# Altium project Control_Board.PrjPcb
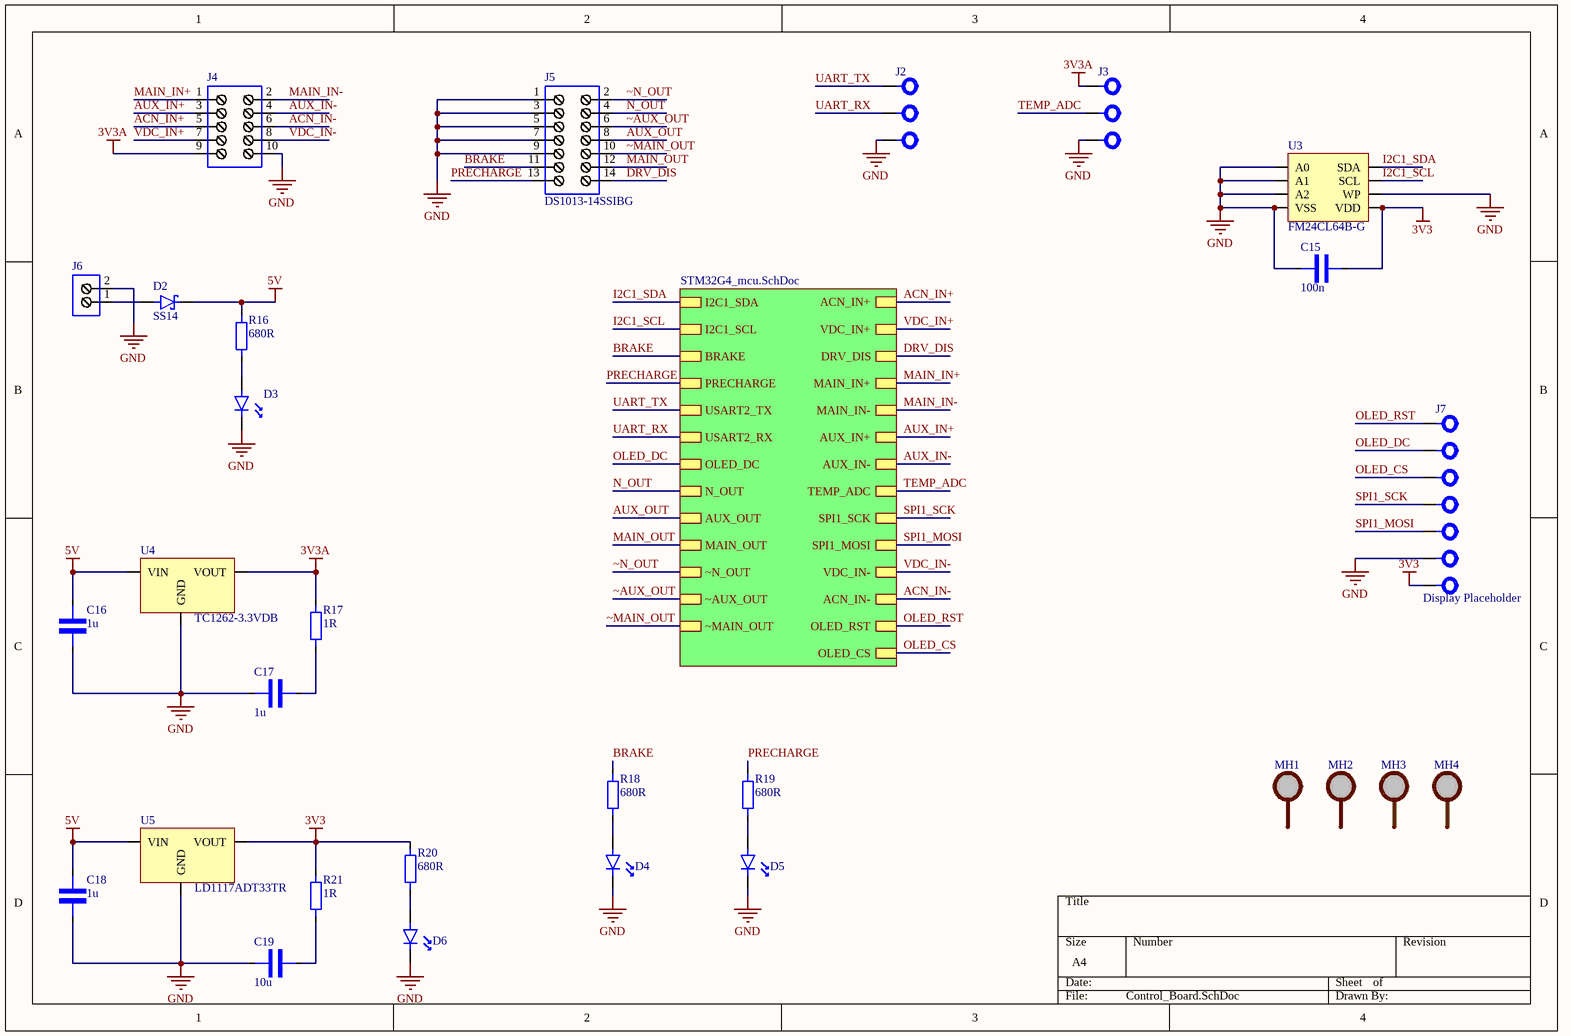
[diagram p0: Control_Board.SchDoc]
2 sheets, 66 parts. Net scope: hierarchical (ports join the sheet entries above them; power ports are global).
Board file: Control_Board.PcbDoc
Sheets:
  Control_Board.SchDoc
    U_STM32G4_mcu = STM32G4_mcu.SchDoc

## Sheet Control_Board.SchDoc
size A4; SheetNumber: 1; SheetTotal: 2

### Parts
C15  100n  [CAPACITOR_0603]
C16  1u  [Capacitor_0805]
C17  1u  [Capacitor_0805]
C18  1u  [Capacitor_0805]
C19  10u  [Capacitor_0805]
D2  SS14  [DIOM5226X230N]
D3  LTST-C171KRKT  [LTST-C171K]  (value not drawn)
D4  LTST-C171KRKT  [LTST-C171K]  (value not drawn)
D5  LTST-C171KRKT  [LTST-C171K]  (value not drawn)
D6  LTST-C171KRKT  [LTST-C171K]  (value not drawn)
J2  Goldpin_3pin  [Goldpin_3pin]  (value not drawn)
J3  Goldpin_3pin  [Goldpin_3pin]  (value not drawn)
J4  DS1013-10SSIB1-B-0  [DS1013-10SSIB1-B-0]  (value not drawn)
J5  DS1013-14SSIBG  [DS1013-14SSIBG]
J6  JST_B2B-XH-A_(LF)(SN)  [JST_B2B-XH-A_(LF)(SN)]  (value not drawn)
J7  Display Placeholder  [Waveshare_25512]
MH1  Mounting Hole  [M3 mounting hole]  (value not drawn)
MH2  Mounting Hole  [M3 mounting hole]  (value not drawn)
MH3  Mounting Hole  [M3 mounting hole]  (value not drawn)
MH4  Mounting Hole  [M3 mounting hole]  (value not drawn)
R16  680R  [RESISTOR_0805]
R17  1R  [RESISTOR_0603]
R18  680R  [RESISTOR_0805]
R19  680R  [RESISTOR_0805]
R20  680R  [RESISTOR_0805]
R21  1R  [RESISTOR_0603]
U3  FM24CL64B-G  [FM24CL64B-G]
U4  TC1262-3.3VDB  [TC1262-3.3VDB]
U5  LD1117ADT33TR  [LD1117ADT33TR]

### Sub-sheets
U_STM32G4_mcu = STM32G4_mcu.SchDoc: I2C1_SDA, I2C1_SCL, BRAKE, PRECHARGE, USART2_TX, USART2_RX, OLED_DC, N_OUT, AUX_OUT, MAIN_OUT, ~N_OUT, ~AUX_OUT, ~MAIN_OUT, ACN_IN+, VDC_IN+, DRV_DIS, MAIN_IN+, MAIN_IN-, AUX_IN+, AUX_IN-, TEMP_ADC, SPI1_SCK, SPI1_MOSI, VDC_IN-, ACN_IN-, OLED_RST, OLED_CS

### Nets
3V3: C15.2 J7.7(VCC) R20.1 R21.2 U3.5(VDD) U5.2(VOUT)
3V3A: J3.1 J4.9 R17.2 U4.3(VOUT)
5V: C16.2 C18.2 D2.2(K) R16.2 U4.1(VIN) U5.3(VIN)
GND: C15.1 C16.1 C17.2 C18.1 C19.2 D3.2(K) D4.2(K) D5.2(K) D6.2(K) J2.3 J3.3 J4.10 J5.1 J5.3 J5.5 J5.7 J5.9 J6.2 J7.6(GND) U3.1(A0) U3.2(A1) U3.3(A2) U3.4(VSS) U3.6(WP) U4.2(GND) U5.1(GND)
ACN_IN+: J4.5 ; sheet U_STM32G4_mcu/ACN_IN+
ACN_IN-: J4.6 ; sheet U_STM32G4_mcu/ACN_IN-
AUX_IN+: J4.3 ; sheet U_STM32G4_mcu/AUX_IN+
AUX_IN-: J4.4 ; sheet U_STM32G4_mcu/AUX_IN-
AUX_OUT: J5.8 ; sheet U_STM32G4_mcu/AUX_OUT
BRAKE: J5.11 R18.1 ; sheet U_STM32G4_mcu/BRAKE
DRV_DIS: J5.14 ; sheet U_STM32G4_mcu/DRV_DIS
I2C1_SCL: U3.7(SCL) ; sheet U_STM32G4_mcu/I2C1_SCL
I2C1_SDA: U3.8(SDA) ; sheet U_STM32G4_mcu/I2C1_SDA
MAIN_IN+: J4.1 ; sheet U_STM32G4_mcu/MAIN_IN+
MAIN_IN-: J4.2 ; sheet U_STM32G4_mcu/MAIN_IN-
MAIN_OUT: J5.12 ; sheet U_STM32G4_mcu/MAIN_OUT
N_OUT: J5.4 ; sheet U_STM32G4_mcu/N_OUT
OLED_CS: J7.3(CS) ; sheet U_STM32G4_mcu/OLED_CS
OLED_DC: J7.2(DC) ; sheet U_STM32G4_mcu/OLED_DC
OLED_RST: J7.1(RST) ; sheet U_STM32G4_mcu/OLED_RST
PRECHARGE: J5.13 R19.1 ; sheet U_STM32G4_mcu/PRECHARGE
SPI1_MOSI: J7.5(DIN) ; sheet U_STM32G4_mcu/SPI1_MOSI
SPI1_SCK: J7.4(CLK) ; sheet U_STM32G4_mcu/SPI1_SCK
TEMP_ADC: J3.2 ; sheet U_STM32G4_mcu/TEMP_ADC
UART_RX: J2.2 ; sheet U_STM32G4_mcu/USART2_RX
UART_TX: J2.1 ; sheet U_STM32G4_mcu/USART2_TX
VDC_IN+: J4.7 ; sheet U_STM32G4_mcu/VDC_IN+
VDC_IN-: J4.8 ; sheet U_STM32G4_mcu/VDC_IN-
~AUX_OUT: J5.6 ; sheet U_STM32G4_mcu/~AUX_OUT
~MAIN_OUT: J5.10 ; sheet U_STM32G4_mcu/~MAIN_OUT
~N_OUT: J5.2 ; sheet U_STM32G4_mcu/~N_OUT
NetC17_1: C17.1 R17.1
NetC19_1: C19.1 R21.1
NetD2_1: D2.1(A) J6.1
NetD3_1: D3.1(A) R16.1
NetD4_1: D4.1(A) R18.2
NetD5_1: D5.1(A) R19.2
NetD6_1: D6.1(A) R20.2

### Library data of the parts
C15 = CAPACITOR_0603: MLCC capacitor in 0603 package
C16-C19 = CAPACITOR_0805: MLCC capacitor in 0805 package
D2 = SS14: 1A, 40V, Schottky Rectifier; MF: Taiwan Semiconductor; SnapEDA_Link: https://www.snapeda.com/parts/SS14/taiwan/view-part/?ref=snap; Package: SMA-2 Taiwan Semiconductor; MP: SS14; Check_prices: https://www.snapeda.com/parts/SS14/taiwan/view-part/?ref=eda
D3-D6 = LTST-C171KRKT: LED; red; SMD; 0805; 18÷54mcd; 2÷2.4VDC; 2x1.25x0.8mm; 130°; 20mA
J2 J3 = Goldpin_3pin: goldpin 3 pin connector
J4 = DS1013-10SSIB1-B-0: Connector: IDC; socket; male; PIN: 10; straight; THT; 2.54mm; 2x5
J5 = DS1013-14SSIBG: Connector: IDC; socket; male; data; PIN: 14; straight; THT; 2.54mm
J6 = JST_B2B-XH-A_(LF)(SN): Connector: wire-board; XH; socket; male; data; 3A; 250V; PIN: 2; 2.5mm
J7 = Waveshare_25512: Waveshare 25512 128x64 OLED display placeholder
MH1-MH4 = M3_mounting_hole
R16 R18-R20 = RESISTOR_0805: SMD resistor in 0805 package
R17 R21 = RESISTOR_0603: SMD resistor in 0603 package
U3 = FM24CL64B-G: IC: FRAM memory; 64kbFRAM; I2C; 8kx8bit; 2.7÷3.6VDC; 1MHz; SO8
U4 = TC1262-3.3VDB: LDO Voltage Regulators 500mA Fixed Output CMOS; pin to pad: 2>2+4
U5 = LD1117ADT33TR: IC: voltage regulator; LDO,linear,fixed; 3.3V; 1A; DPAK; SMD; ±4%

## Sheet STM32G4_mcu.SchDoc
size A4; SheetNumber: 2; SheetTotal: 2
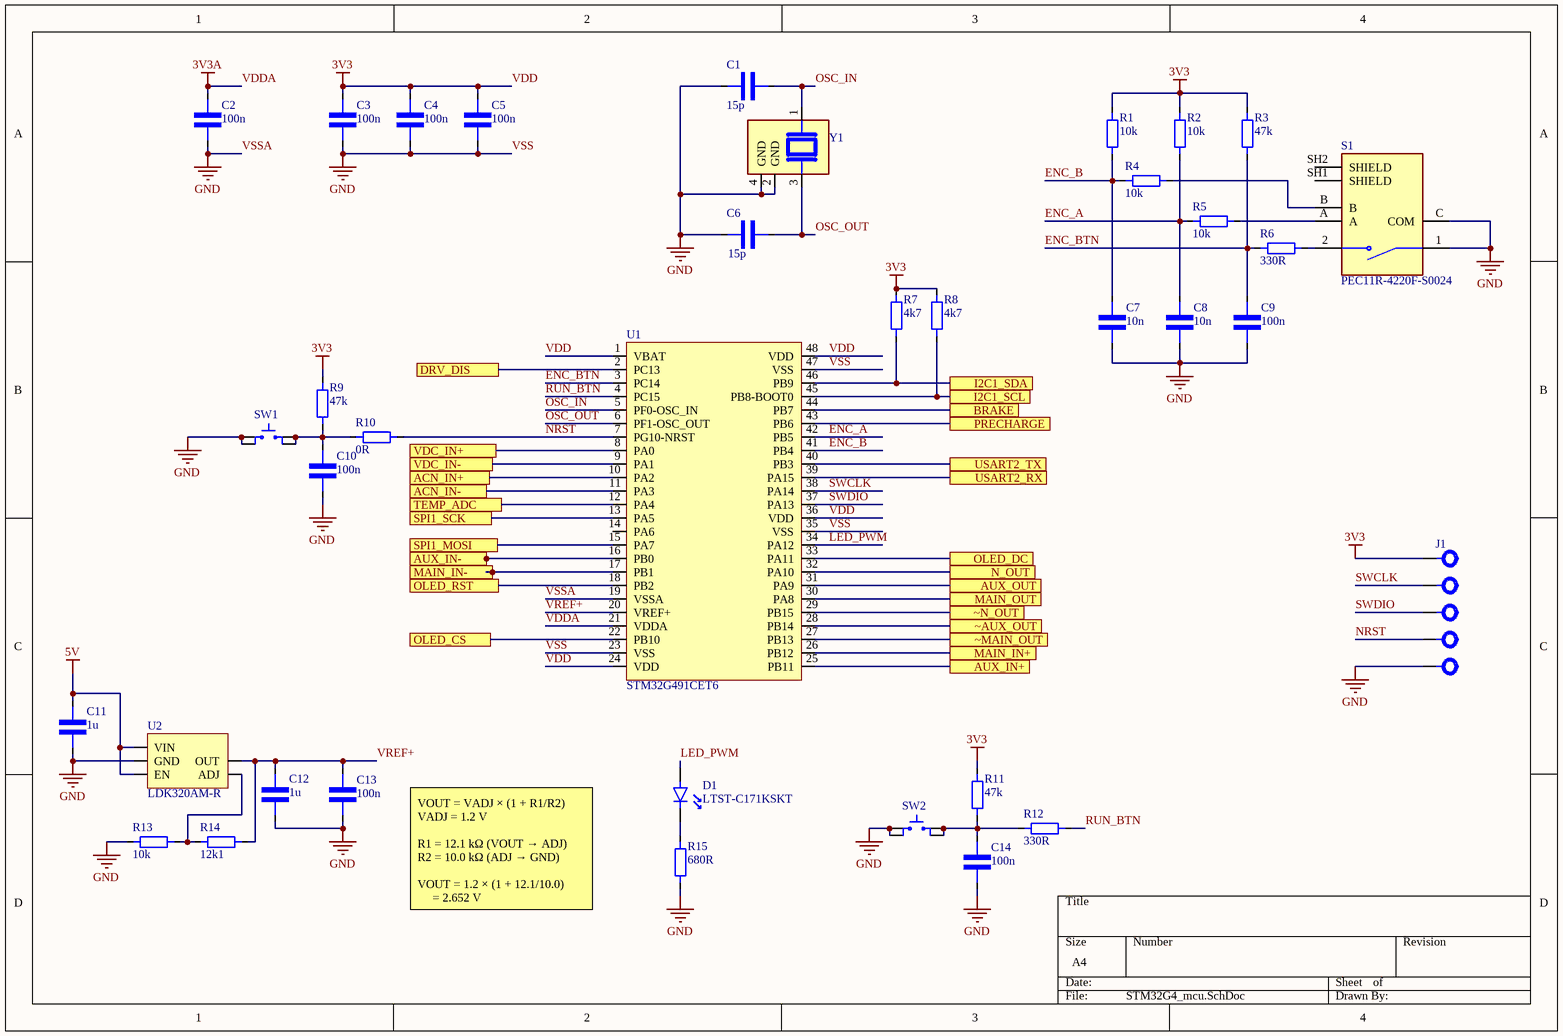
[diagram p1: STM32G4_mcu.SchDoc]

### Parts
C1  15p  [CAPACITOR_0603]
C2  100n  [CAPACITOR_0603]
C3  100n  [CAPACITOR_0603]
C4  100n  [CAPACITOR_0603]
C5  100n  [CAPACITOR_0603]
C6  15p  [CAPACITOR_0603]
C7  10n  [CAPACITOR_0603]
C8  10n  [CAPACITOR_0603]
C9  100n  [CAPACITOR_0603]
C10  100n  [CAPACITOR_0603]
C11  1u  [Capacitor_0805]
C12  1u  [Capacitor_0805]
C13  100n  [CAPACITOR_0603]
C14  100n  [CAPACITOR_0603]
D1  LTST-C171KSKT  [LTST-C171K]
J1  Goldpin_5pin  [Goldpin_5pin]  (value not drawn)
R1  10k  [RESISTOR_0603]
R2  10k  [RESISTOR_0603]
R3  47k  [RESISTOR_0603]
R4  10k  [RESISTOR_0603]
R5  10k  [RESISTOR_0603]
R6  330R  [RESISTOR_0603]
R7  4k7  [RESISTOR_0603]
R8  4k7  [RESISTOR_0603]
R9  47k  [RESISTOR_0603]
R10  0R  [RESISTOR_0603]
R11  47k  [RESISTOR_0603]
R12  330R  [RESISTOR_0603]
R13  10k  [RESISTOR_0603]
R14  12k1  [RESISTOR_0603]
R15  680R  [RESISTOR_0805]
S1  PEC11R-4220F-S0024  [XDCR_PEC11R-4220F-S0024]
SW1  TACT-67N-F  [TACT-67N-F]  (value not drawn)
SW2  TACT-67N-F  [TACT-67N-F]  (value not drawn)
U1  STM32G491CET6  [QFP50P900X900X160-48N]
U2  LDK320AM-R  [LDK320AM-]
Y1  QT532S-8.000MEEQ-T  [XTAL_QT532S-8.000MEEQ-T]  (value not drawn)

### Ports
ACN_IN+, ACN_IN-, AUX_IN+, AUX_IN-, AUX_OUT, BRAKE, DRV_DIS, I2C1_SCL, I2C1_SDA, MAIN_IN+, MAIN_IN-, MAIN_OUT, N_OUT, OLED_CS, OLED_DC, OLED_RST, PRECHARGE, SPI1_MOSI, SPI1_SCK, TEMP_ADC, USART2_RX, USART2_TX, VDC_IN+, VDC_IN-, ~AUX_OUT, ~MAIN_OUT, ~N_OUT

### Nets
3V3: C3.2 C4.2 C5.2 J1.1 R1.2 R2.2 R3.2 R7.2 R8.2 R9.2 R11.2 U1.1(VBAT) U1.24(VDD) U1.36(VDD) U1.48(VDD)  [also labelled VDD]
3V3A: C2.2 U1.21(VDDA)  [also labelled VDDA]
5V: C11.2 U2.1(VIN) U2.3(EN)
GND: C1.1 C2.1 C3.1 C4.1 C5.1 C6.2 C7.1 C8.1 C9.1 C10.1 C11.1 C12.1 C13.1 C14.1 J1.5 R13.1 R15.1 S1.1 S1.C(COM) SW1.1 SW1.2 SW2.1 SW2.2 U1.19(VSSA) U1.23(VSS) U1.35(VSS) U1.47(VSS) U2.2(GND) Y1.2(GND) Y1.4(GND)  [also labelled VSS, VSSA]
ACN_IN+: U1.10(PA2) ; port ACN_IN+
ACN_IN-: U1.11(PA3) ; port ACN_IN-
AUX_IN+: U1.25(PB11) ; port AUX_IN+
AUX_IN-: U1.16(PB0) ; port AUX_IN-
AUX_OUT: U1.31(PA9) ; port AUX_OUT
BRAKE: U1.44(PB7) ; port BRAKE
DRV_DIS: U1.2(PC13) ; port DRV_DIS
ENC_A: C8.2 R2.1 R5.2 U1.42(PB5)
ENC_B: C7.2 R1.1 R4.1 U1.41(PB4)
ENC_BTN: C9.2 R3.1 R6.2 U1.3(PC14)
I2C1_SCL: R8.1 U1.45(PB8-BOOT0) ; port I2C1_SCL
I2C1_SDA: R7.1 U1.46(PB9) ; port I2C1_SDA
LED_PWM: D1.1(A) U1.34(PA12)
MAIN_IN+: U1.26(PB12) ; port MAIN_IN+
MAIN_IN-: U1.17(PB1) ; port MAIN_IN-
MAIN_OUT: U1.30(PA8) ; port MAIN_OUT
N_OUT: U1.32(PA10) ; port N_OUT
NRST: J1.4 R10.1 U1.7(PG10-NRST)
OLED_CS: U1.22(PB10) ; port OLED_CS
OLED_DC: U1.33(PA11) ; port OLED_DC
OLED_RST: U1.18(PB2) ; port OLED_RST
OSC_IN: C1.2 U1.5(PF0-OSC_IN) Y1.1
OSC_OUT: C6.1 U1.6(PF1-OSC_OUT) Y1.3
PRECHARGE: U1.43(PB6) ; port PRECHARGE
RUN_BTN: R12.1 U1.4(PC15)
SPI1_MOSI: U1.15(PA7) ; port SPI1_MOSI
SPI1_SCK: U1.13(PA5) ; port SPI1_SCK
SWCLK: J1.2 U1.38(PA14)
SWDIO: J1.3 U1.37(PA13)
TEMP_ADC: U1.12(PA4) ; port TEMP_ADC
UART_RX: U1.39(PA15) ; port USART2_RX
UART_TX: U1.40(PB3) ; port USART2_TX
VDC_IN+: U1.8(PA0) ; port VDC_IN+
VDC_IN-: U1.9(PA1) ; port VDC_IN-
VREF+: C12.2 C13.2 R14.2 U1.20(VREF+) U2.5(OUT)
~AUX_OUT: U1.28(PB14) ; port ~AUX_OUT
~MAIN_OUT: U1.27(PB13) ; port ~MAIN_OUT
~N_OUT: U1.29(PB15) ; port ~N_OUT
NetC10_2: C10.2 R9.1 R10.2 SW1.3 SW1.4
NetC14_2: C14.2 R11.1 R12.2 SW2.3 SW2.4
NetD1_2: D1.2(K) R15.2
NetR4_2: R4.2 S1.B
NetR5_1: R5.1 S1.A
NetR6_1: R6.1 S1.2
NetR13_2: R13.2 R14.1 U2.4(ADJ)

Not connected (* = marked no-connect by the designer): S1 SH1(SHIELD) SH2(SHIELD); U1 14(PA6)

### Notes on the sheet
- VOUT = VADJ × (1 + R1/R2)
  VADJ = 1.2 V
  R1 = 12.1 kΩ (VOUT → ADJ)
  R2 = 10.0 kΩ (ADJ → GND)
  VOUT = 1.2 × (1 + 12.1/10.0)
  = 2.652 V

### Library data of the parts
C1-C10 C13 C14 = CAPACITOR_0603: MLCC capacitor in 0603 package
C11 C12 = CAPACITOR_0805: MLCC capacitor in 0805 package
D1 = LTST-C171KSKT: LED; yellow; SMD; 0805; 18÷180mcd; 1.6÷2.4VDC; 2x1.25x0.8mm; 130°
J1 = Goldpin_5pin: Goldpin 5pin connector
R1-R12 = RESISTOR_0603: SMD resistor in 0603 package
R13 R14 = RESISTOR_0603: SMD resistor in 0603 package; Tolerance: 0,1%
R15 = RESISTOR_0805: SMD resistor in 0805 package
S1 = PEC11R-4220F-S0024: MF: {'manufacturer': u'Bourns Inc.'}; Package: None; Price: None; Value: *; MP: PEC11R-4220F-S0024; Availability: Unavailable
SW1 SW2 = TACT-67N-F: Microswitch TACT; SPST-NO; Pos: 2; 0.05A/12VDC; THT; none; 1.6N
U1 = STM32G491CET6: IC: STM32 ARM microcontroller; 170MHz; LQFP48; 1.71÷3.6VDC
U2 = LDK320AM-R: IC: voltage regulator; LDO,linear,adjustable; 1.2÷12V; 0.2A; SMD
Y1 = QT532S-8.000MEEQ-T: 8 MHz Â±10ppm Crystal 10pF 80 Ohms 4-SMD, No Lead; MF: QST PRODUCTS LLC; SnapEDA_Link: https://www.snapeda.com/parts/QT532S-8.000MEEQ-T/QST+PRODUCTS+LLC/view-part/?ref=snap; Package: NON STANDARD-4 QST PRODUCTS LLC; Value: *; MP: QT532S-8.000MEEQ-T; Check_prices: https://www.snapeda.com/parts/QT532S-8.000MEEQ-T/QST+PRODUCTS+LLC/view-part/?ref=eda

## Nets that join several sheets
3V3: Control_Board (6 pins), STM32G4_mcu (15 pins)
3V3A: Control_Board (J3.1 J4.9 R17.2 U4.3), STM32G4_mcu (C2.2 U1.21)
5V: Control_Board (6 pins), STM32G4_mcu (C11.2 U2.1 U2.3)
GND: Control_Board (26 pins), STM32G4_mcu (30 pins)
ACN_IN+: Control_Board (J4.5), STM32G4_mcu (U1.10)
ACN_IN-: Control_Board (J4.6), STM32G4_mcu (U1.11)
AUX_IN+: Control_Board (J4.3), STM32G4_mcu (U1.25)
AUX_IN-: Control_Board (J4.4), STM32G4_mcu (U1.16)
AUX_OUT: Control_Board (J5.8), STM32G4_mcu (U1.31)
BRAKE: Control_Board (J5.11 R18.1), STM32G4_mcu (U1.44)
DRV_DIS: Control_Board (J5.14), STM32G4_mcu (U1.2)
I2C1_SCL: Control_Board (U3.7), STM32G4_mcu (R8.1 U1.45)
I2C1_SDA: Control_Board (U3.8), STM32G4_mcu (R7.1 U1.46)
MAIN_IN+: Control_Board (J4.1), STM32G4_mcu (U1.26)
MAIN_IN-: Control_Board (J4.2), STM32G4_mcu (U1.17)
MAIN_OUT: Control_Board (J5.12), STM32G4_mcu (U1.30)
N_OUT: Control_Board (J5.4), STM32G4_mcu (U1.32)
OLED_CS: Control_Board (J7.3), STM32G4_mcu (U1.22)
OLED_DC: Control_Board (J7.2), STM32G4_mcu (U1.33)
OLED_RST: Control_Board (J7.1), STM32G4_mcu (U1.18)
PRECHARGE: Control_Board (J5.13 R19.1), STM32G4_mcu (U1.43)
SPI1_MOSI: Control_Board (J7.5), STM32G4_mcu (U1.15)
SPI1_SCK: Control_Board (J7.4), STM32G4_mcu (U1.13)
TEMP_ADC: Control_Board (J3.2), STM32G4_mcu (U1.12)
UART_RX: Control_Board (J2.2), STM32G4_mcu (U1.39)
UART_TX: Control_Board (J2.1), STM32G4_mcu (U1.40)
VDC_IN+: Control_Board (J4.7), STM32G4_mcu (U1.8)
VDC_IN-: Control_Board (J4.8), STM32G4_mcu (U1.9)
~AUX_OUT: Control_Board (J5.6), STM32G4_mcu (U1.28)
~MAIN_OUT: Control_Board (J5.10), STM32G4_mcu (U1.27)
~N_OUT: Control_Board (J5.2), STM32G4_mcu (U1.29)